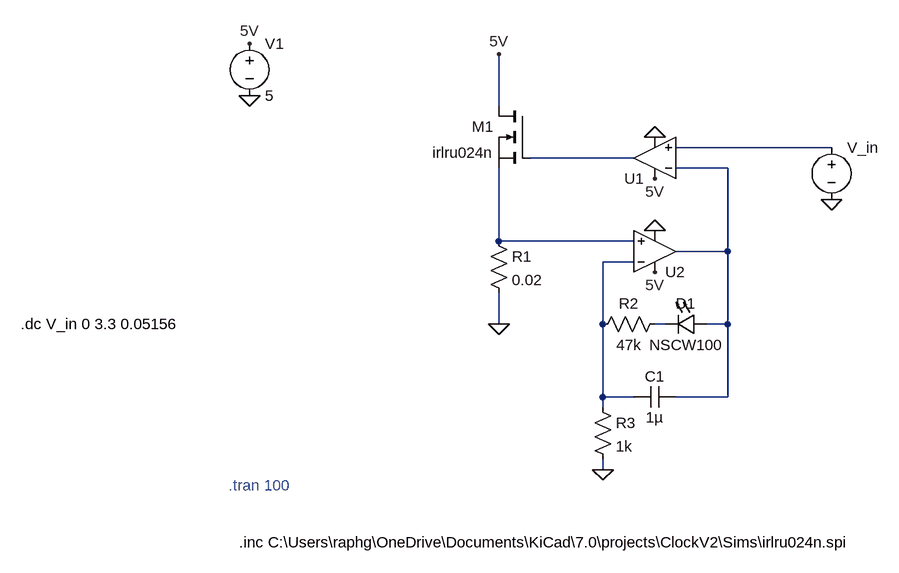
[diagram p0: schematic Heater.asc]
Heater.asc, the LTspice schematic file:
Version 4
SHEET 1 880 680
WIRE 48 -336 48 -416
WIRE 560 -272 320 -272
WIRE 256 -256 96 -256
WIRE 400 -240 320 -240
WIRE 48 -128 48 -240
WIRE 256 -128 48 -128
WIRE 400 -112 400 -240
WIRE 400 -112 320 -112
WIRE 256 -96 208 -96
WIRE 48 0 48 -48
WIRE 208 0 208 -96
WIRE 304 0 288 0
WIRE 400 0 400 -112
WIRE 400 0 368 0
WIRE 208 112 208 0
WIRE 256 112 208 112
WIRE 400 112 400 0
WIRE 400 112 320 112
WIRE 208 128 208 112
WIRE 208 224 208 208
FLAG -336 -352 0
FLAG -336 -432 5V
FLAG 48 -416 5V
FLAG 48 0 0
FLAG 288 -224 5V
FLAG 288 -288 0
FLAG 288 -80 5V
FLAG 288 -144 0
FLAG 208 224 0
FLAG 560 -192 0
SYMBOL res 32 -144 R0
SYMATTR InstName R1
SYMATTR Value 0.02
SYMBOL voltage -336 -448 R0
WINDOW 123 0 0 Left 0
WINDOW 39 0 0 Left 0
SYMATTR InstName V1
SYMATTR Value 5
SYMBOL OpAmps\\UniversalOpAmp2 288 -256 R180
SYMATTR InstName U1
SYMBOL OpAmps\\UniversalOpAmp2 288 -112 M180
SYMATTR InstName U2
SYMBOL res 304 -16 R90
WINDOW 0 0 56 VBottom 2
WINDOW 3 32 56 VTop 2
SYMATTR InstName R2
SYMATTR Value 47k
SYMBOL LED 368 -16 R90
WINDOW 0 0 32 VBottom 2
WINDOW 3 32 32 VTop 2
SYMATTR InstName D1
SYMATTR Value NSCW100
SYMATTR Description Diode
SYMATTR Type diode
SYMBOL res 192 112 R0
SYMATTR InstName R3
SYMATTR Value 1k
SYMBOL cap 320 96 R90
WINDOW 0 0 32 VBottom 2
WINDOW 3 32 32 VTop 2
SYMATTR InstName C1
SYMATTR Value 1µ
SYMBOL voltage 560 -288 R0
WINDOW 123 0 0 Left 0
WINDOW 39 0 0 Left 0
SYMATTR InstName V_in
SYMATTR Value ""
SYMBOL nmos 96 -336 M0
SYMATTR InstName M1
SYMATTR Value irlru024n
SYMATTR Prefix X
TEXT -368 248 Left 2 ;.tran 100
TEXT -352 336 Left 2 !.inc C:\\Users\\raphg\\OneDrive\\Documents\\KiCad\\7.0\\projects\\ClockV2\\Sims\\irlru024n.spi
TEXT -688 0 Left 2 !.dc V_in 0 3.3 0.05156

The netlist it stands for:
* Heater.asc
R1 N004 0 0.02
V1 5V 0 5
XU1 N001 N003 5V 0 N002 level2 Avol=1Meg GBW=10Meg Slew=10Meg Ilimit=25m Rail=0 Vos=0 En=0 Enk=0 In=0 Ink=0 Rin=500Meg  ; pins In+ In- V+ V- OUT
XU2 N004 N005 5V 0 N003 level2 Avol=1Meg GBW=10Meg Slew=10Meg Ilimit=25m Rail=0 Vos=0 En=0 Enk=0 In=0 Ink=0 Rin=500Meg  ; pins In+ In- V+ V- OUT
R2 N006 N005 47k
D1 N003 N006 NSCW100
R3 N005 0 1k
C1 N003 N005 1µ
V_in N001 0
XM1 5V N002 N004 irlru024n  ; pins D G S
.model D D
.lib standard.dio
* .tran 100
.inc C:\Users\raphg\OneDrive\Documents\KiCad\7.0\projects\ClockV2\Sims\irlru024n.spi
.dc V_in 0 3.3 0.05156
.lib UniversalOpAmp2.lib
.backanno
.end